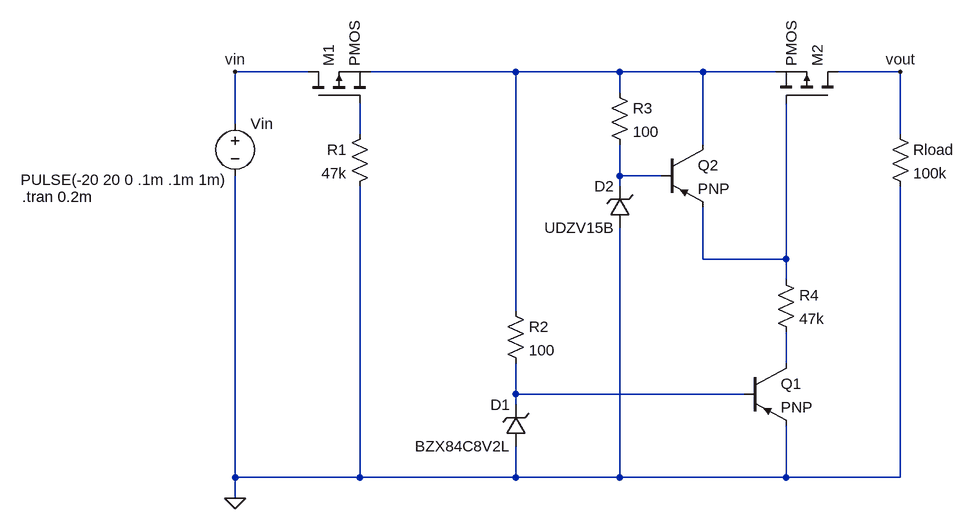
[diagram p0: schematic A5 Part 1 overvoltage.asc]
A5 Part 1 overvoltage.asc, the LTspice schematic file:
Version 4.1
SHEET 1 1796 1572
WIRE -592 848 -704 848
WIRE -272 848 -496 848
WIRE -112 848 -272 848
WIRE 16 848 -112 848
WIRE 128 848 16 848
WIRE 320 848 224 848
WIRE -112 880 -112 848
WIRE -704 928 -704 848
WIRE -512 944 -512 896
WIRE 320 944 320 848
WIRE 16 960 16 848
WIRE -112 1008 -112 960
WIRE -48 1008 -112 1008
WIRE -112 1024 -112 1008
WIRE 16 1136 16 1056
WIRE 144 1136 144 896
WIRE 144 1136 16 1136
WIRE 144 1168 144 1136
WIRE -272 1216 -272 848
WIRE 144 1296 144 1248
WIRE -272 1344 -272 1296
WIRE 80 1344 -272 1344
WIRE -272 1360 -272 1344
WIRE -704 1472 -704 1008
WIRE -512 1472 -512 1024
WIRE -512 1472 -704 1472
WIRE -272 1472 -272 1424
WIRE -272 1472 -512 1472
WIRE -112 1472 -112 1088
WIRE -112 1472 -272 1472
WIRE 144 1472 144 1392
WIRE 144 1472 -112 1472
WIRE 320 1472 320 1024
WIRE 320 1472 144 1472
WIRE -704 1504 -704 1472
FLAG -704 1504 0
FLAG 320 848 vout
FLAG -704 848 vin
SYMBOL voltage -704 912 R0
WINDOW 3 -330 102 Left 2
WINDOW 123 0 0 Left 0
WINDOW 39 0 0 Left 0
SYMATTR Value PULSE(-20 20 0 .1m .1m 1m)
SYMATTR InstName Vin
SYMBOL res 304 928 R0
SYMATTR InstName Rload
SYMATTR Value 100k
SYMBOL zener -96 1088 R180
WINDOW 0 24 64 Left 2
WINDOW 3 24 0 Left 2
SYMATTR InstName D2
SYMATTR Value UDZV15B
SYMATTR Description Diode
SYMATTR Type diode
SYMBOL res -128 864 R0
SYMATTR InstName R3
SYMATTR Value 100
SYMBOL res -496 928 M0
SYMATTR InstName R1
SYMATTR Value 47k
SYMBOL pmos -592 896 R270
SYMATTR InstName M1
SYMBOL pmos 224 896 M270
SYMATTR InstName M2
SYMBOL pnp -48 960 R0
SYMATTR InstName Q2
SYMBOL zener -256 1424 R180
WINDOW 0 24 64 Left 2
WINDOW 3 24 0 Left 2
SYMATTR InstName D1
SYMATTR Value BZX84C8V2L
SYMATTR Description Diode
SYMATTR Type diode
SYMBOL res -288 1200 R0
SYMATTR InstName R2
SYMATTR Value 100
SYMBOL pnp 80 1296 R0
SYMATTR InstName Q1
SYMBOL res 128 1152 R0
SYMATTR InstName R4
SYMATTR Value 47k
TEXT -1032 1040 Left 2 !.tran 0.2m

The netlist it stands for:
* A5 Part 1 overvoltage.asc
Vin vin 0 PULSE(-20 20 0 .1m .1m 1m)
Rload vout 0 100k
D2 0 N003 UDZV15B
R3 N001 N003 100
R1 N002 0 47k
M1 vin N002 N001 N001 PMOS
M2 vout N004 N001 N001 PMOS
Q2 N001 N003 N004 0 PNP
D1 0 N006 BZX84C8V2L
R2 N001 N006 100
Q1 N005 N006 0 0 PNP
R4 N004 N005 47k
.model D D
.lib standard.dio
.model NPN NPN
.model PNP PNP
.lib standard.bjt
.model NMOS NMOS
.model PMOS PMOS
.lib standard.mos
.tran 0.2m
.backanno
.end